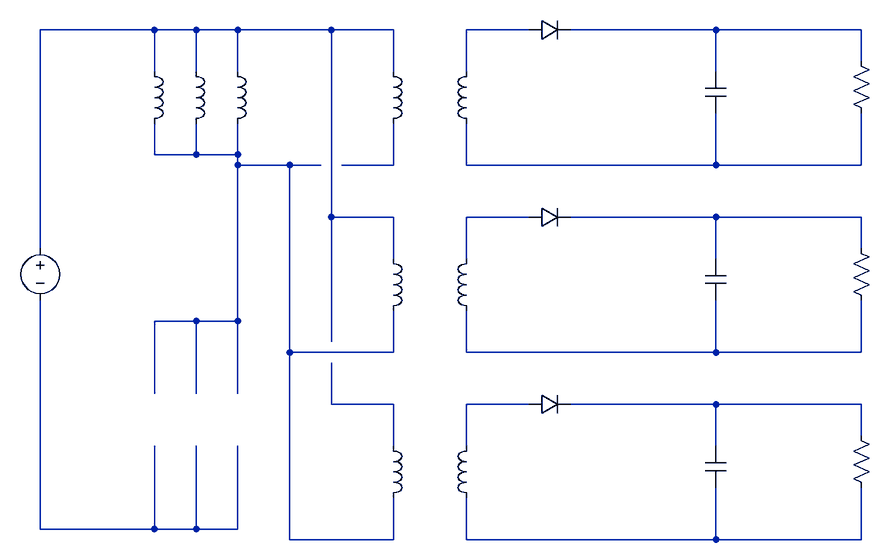
[diagram p0: schematic Flyback_Converter_Multi_Winding_Multiple_Primary_Multiple_Switched_Inductor_Shared_for_Documentation.asc]
Flyback_Converter_Multi_Winding_Multiple_Primary_Multiple_Switched_Inductor_Shared_for_Documentation.asc, the LTspice schematic file:
Version 4.1
SHEET 1 1176 744
WIRE 32 -48 -144 -48
WIRE 96 -48 32 -48
WIRE 160 -48 96 -48
WIRE 304 -48 160 -48
WIRE 400 -48 304 -48
WIRE 608 -48 512 -48
WIRE 896 -48 672 -48
WIRE 1120 -48 896 -48
WIRE 1120 0 1120 -48
WIRE 32 16 32 -48
WIRE 96 16 96 -48
WIRE 160 16 160 -48
WIRE 400 16 400 -48
WIRE 512 16 512 -48
WIRE 896 16 896 -48
WIRE 32 144 32 96
WIRE 96 144 96 96
WIRE 96 144 32 144
WIRE 160 144 160 96
WIRE 160 144 96 144
WIRE 160 160 160 144
WIRE 240 160 160 160
WIRE 288 160 240 160
WIRE 400 160 400 96
WIRE 400 160 320 160
WIRE 512 160 512 96
WIRE 896 160 896 80
WIRE 896 160 512 160
WIRE 1120 160 1120 80
WIRE 1120 160 896 160
WIRE 304 240 304 -48
WIRE 400 240 304 240
WIRE 608 240 512 240
WIRE 896 240 672 240
WIRE 1120 240 896 240
WIRE -144 288 -144 -48
WIRE 1120 288 1120 240
WIRE 400 304 400 240
WIRE 512 304 512 240
WIRE 896 304 896 240
WIRE 96 400 32 400
WIRE 160 400 160 160
WIRE 160 400 96 400
WIRE 304 432 304 240
WIRE 240 448 240 160
WIRE 400 448 400 384
WIRE 400 448 240 448
WIRE 512 448 512 384
WIRE 896 448 896 368
WIRE 896 448 512 448
WIRE 1120 448 1120 368
WIRE 1120 448 896 448
WIRE 32 512 32 400
WIRE 96 512 96 400
WIRE 160 512 160 400
WIRE 304 528 304 464
WIRE 400 528 304 528
WIRE 608 528 512 528
WIRE 896 528 672 528
WIRE 1120 528 896 528
WIRE 1120 576 1120 528
WIRE 400 592 400 528
WIRE 512 592 512 528
WIRE 896 592 896 528
WIRE -144 720 -144 368
WIRE 32 720 32 592
WIRE 32 720 -144 720
WIRE 96 720 96 592
WIRE 96 720 32 720
WIRE 160 720 160 592
WIRE 160 720 96 720
WIRE 240 736 240 448
WIRE 400 736 400 672
WIRE 400 736 240 736
WIRE 512 736 512 672
WIRE 896 736 896 656
WIRE 896 736 512 736
WIRE 1120 736 1120 656
WIRE 1120 736 896 736
SYMBOL ind 144 0 R0
WINDOW 0 36 40 Invisible 2
WINDOW 3 36 80 Invisible 2
SYMATTR InstName L1
SYMBOL ind 528 0 M0
WINDOW 0 36 40 Invisible 2
WINDOW 3 36 80 Invisible 2
SYMATTR InstName L3
SYMBOL voltage -144 272 R0
WINDOW 0 24 16 Invisible 2
WINDOW 3 24 96 Invisible 2
SYMATTR InstName V1
SYMBOL diode 608 -32 R270
WINDOW 0 32 32 Invisible 2
WINDOW 3 0 32 Invisible 2
SYMATTR InstName D1
SYMBOL cap 880 16 R0
WINDOW 0 24 8 Invisible 2
WINDOW 3 24 56 Invisible 2
SYMATTR InstName C1
SYMBOL res 1104 -16 R0
WINDOW 0 36 40 Invisible 2
WINDOW 3 36 76 Invisible 2
SYMATTR InstName R1
SYMBOL ind 528 288 M0
WINDOW 0 36 40 Invisible 2
WINDOW 3 36 80 Invisible 2
SYMATTR InstName L5
SYMBOL diode 608 256 R270
WINDOW 0 32 32 Invisible 2
WINDOW 3 0 32 Invisible 2
SYMATTR InstName D2
SYMBOL cap 880 304 R0
WINDOW 0 24 8 Invisible 2
WINDOW 3 24 56 Invisible 2
SYMATTR InstName C2
SYMBOL res 1104 272 R0
WINDOW 0 36 40 Invisible 2
WINDOW 3 36 76 Invisible 2
SYMATTR InstName R2
SYMBOL ind 528 576 M0
WINDOW 0 36 40 Invisible 2
WINDOW 3 36 80 Invisible 2
SYMATTR InstName L7
SYMBOL diode 608 544 R270
WINDOW 0 32 32 Invisible 2
WINDOW 3 0 32 Invisible 2
SYMATTR InstName D3
SYMBOL cap 880 592 R0
WINDOW 0 24 8 Invisible 2
WINDOW 3 24 56 Invisible 2
SYMATTR InstName C3
SYMBOL res 1104 560 R0
WINDOW 0 36 40 Invisible 2
WINDOW 3 36 76 Invisible 2
SYMATTR InstName R3
SYMBOL ind 384 0 R0
WINDOW 0 36 40 Invisible 2
WINDOW 3 36 80 Invisible 2
SYMATTR InstName L4
SYMBOL ind 384 288 R0
WINDOW 0 36 40 Invisible 2
WINDOW 3 36 80 Invisible 2
SYMATTR InstName L6
SYMBOL ind 384 576 R0
WINDOW 0 36 40 Invisible 2
WINDOW 3 36 80 Invisible 2
SYMATTR InstName L8
SYMBOL ind 80 0 R0
WINDOW 0 36 40 Invisible 2
WINDOW 3 36 80 Invisible 2
SYMATTR InstName L2
SYMBOL ind 16 0 R0
WINDOW 0 36 40 Invisible 2
WINDOW 3 36 80 Invisible 2
SYMATTR InstName L9

The netlist it stands for:
* Flyback_Converter_Multi_Winding_Multiple_Primary_Multiple_Switched_Inductor_Shared_for_Documentation.asc
L1 N001 N004 L
L3 N002 N006 L
V1 N001 N013 V
D1 N002 N003 D
C1 N003 N006 C
R1 N003 N006 R
L5 N007 N009 L
D2 N007 N008 D
C2 N008 N009 C
R2 N008 N009 R
L7 N011 N014 L
D3 N011 N012 D
C3 N012 N014 C
R3 N012 N014 R
L4 N001 N005 L
L6 N001 N004 L
L8 N010 N004 L
L2 N001 N004 L
L9 N001 N004 L
.model D D
.lib standard.dio
.backanno
.end